# EAGLE design Fire_Alarm (EAGLE 9.6.2)
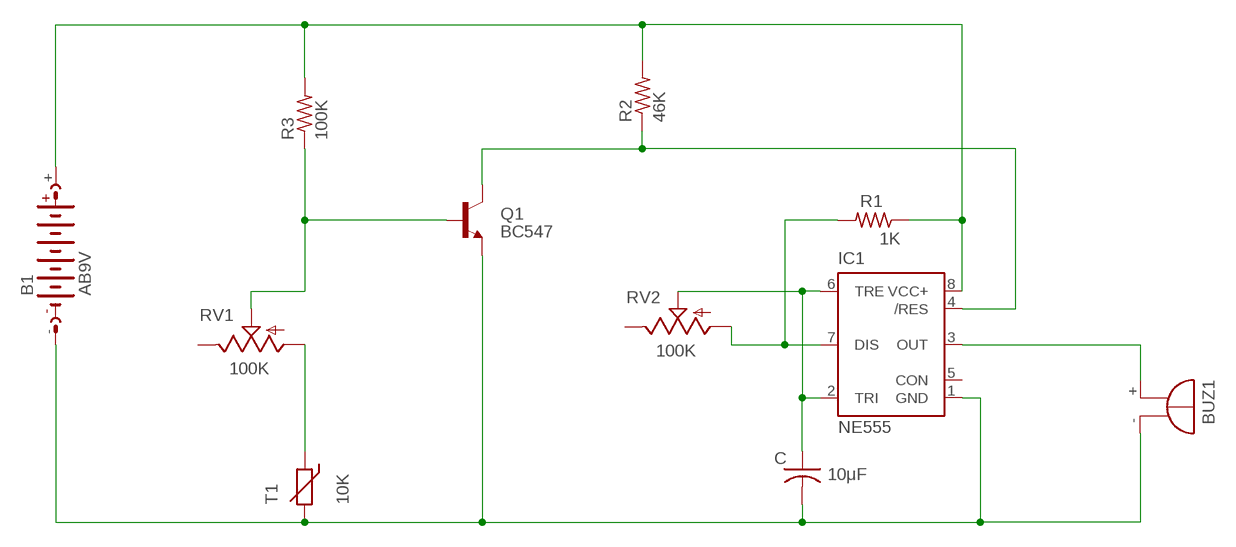
[diagram p0: schematic, sheet 1]

## Parts
B1  AB9V  [AB9V]
BUZ1  F/TMB  [F/TMB]
C  10μF  C-US050-024X044  [C050-024X044]
IC1  NE555  [DIL-08]
Q1  BC547  [TO92]
R1  1K  R-US_0204/7  [0204/7]
R2  46K  R-US_0204/7  [0204/7]
R3  100K  R-US_0204/7  [0204/7]
RV1  100K  TRIM_US-CA9V  [CA9V]
RV2  100K  TRIM_US-CA9V  [CA9V]
T1  10K  THERMISTOR-7,5  [R-7,5]

## Nets
N$1: BUZ1.+ IC1.3(OUT)
N$3: Q1.2(B) R3.1 RV1.S
N$4: RV1.A T1.1
N$5: B1.- BUZ1.- C.2 IC1.1(GND) Q1.1(E) T1.2
N$6: IC1.4(/RES) Q1.3(C) R2.1
N$7: IC1.7(DIS) R1.2 RV2.A
N$8: C.1 IC1.2(TRI) IC1.6(TRE) RV2.S
N$9: B1.+ IC1.8(VCC+) R1.1 R2.2 R3.2
Unconnected: IC1.5(CON) RV1.E RV2.E

## Library data of the parts
B1 = battery:AB9V: 9-V BATTERY CLIP
BUZ1 = buzzer:F/TMB: BUZZER Source: Buerklin; OC_FARNELL: unknown; OC_NEWARK: unknown
C = rcl:C-US: CAPACITOR, American symbol; SPICEPREFIX: C
IC1 = st-microelectronics:NE555: General purpose bipolar Timer; MF: Arrow Electronics; MPN: NE555N; OC_FARNELL: 1467742; OC_NEWARK: 89K1486
Q1 = transistor:BC547: NPN TRANSISTOR
R1-R3 = rcl:R-US_: RESISTOR, American symbol; SPICEPREFIX: R
RV1 RV2 = pot:TRIM_US-: POTENTIOMETER
T1 = varistor:THERMISTOR: THERMISTOR

## Board
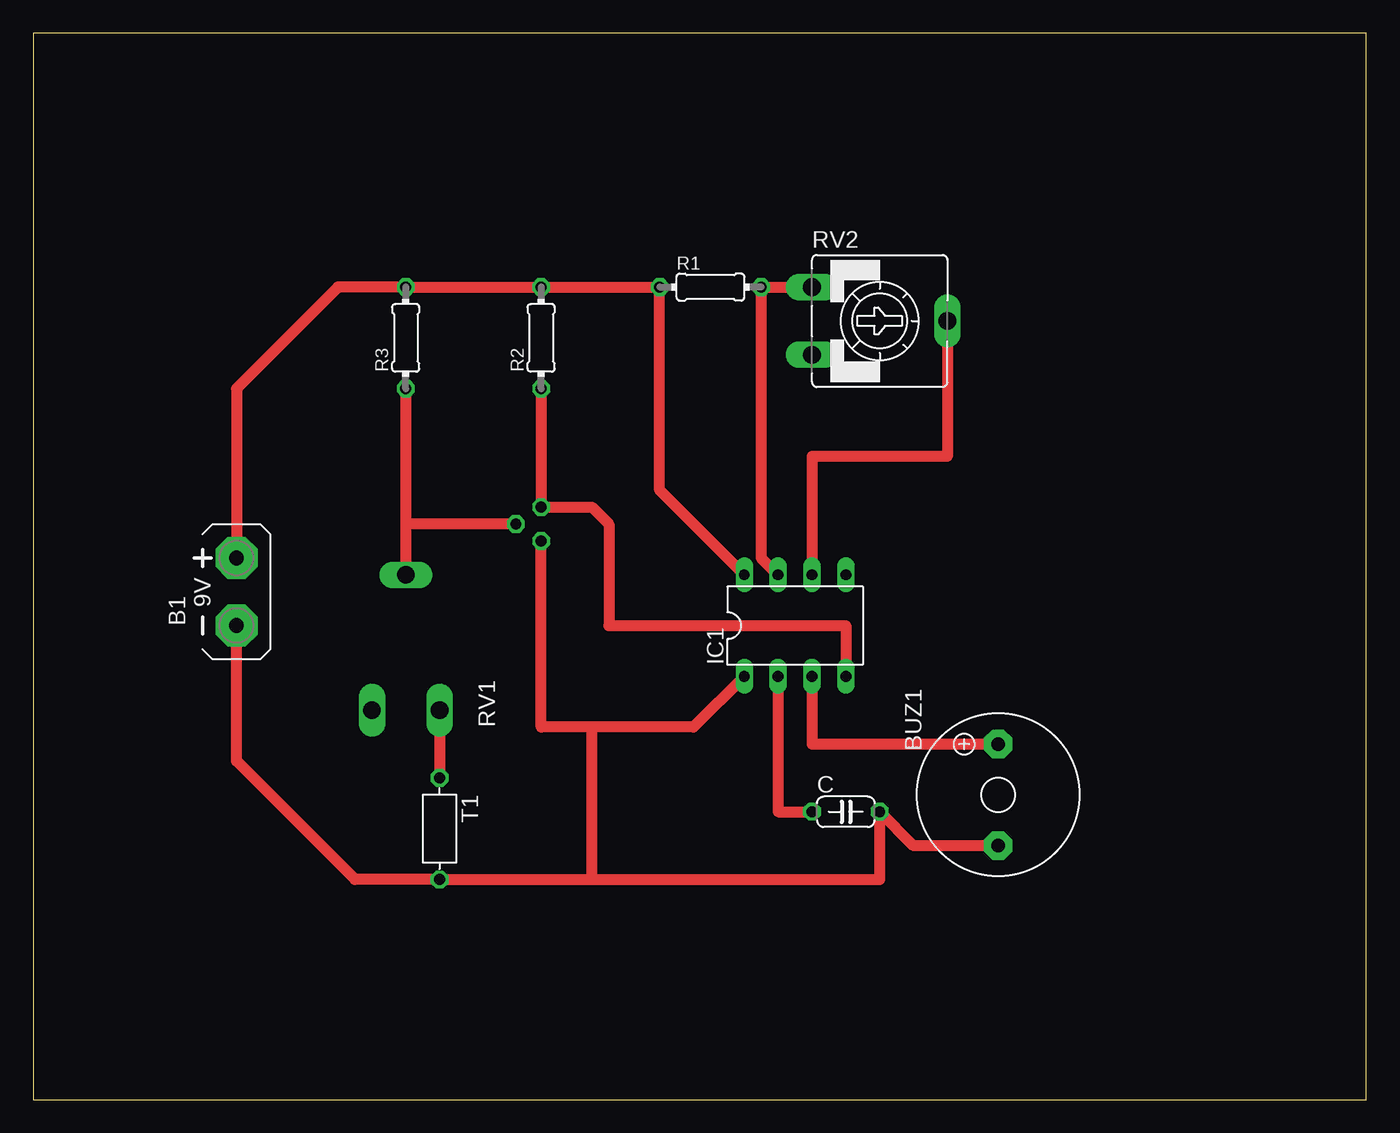
[diagram p1: board, top side]
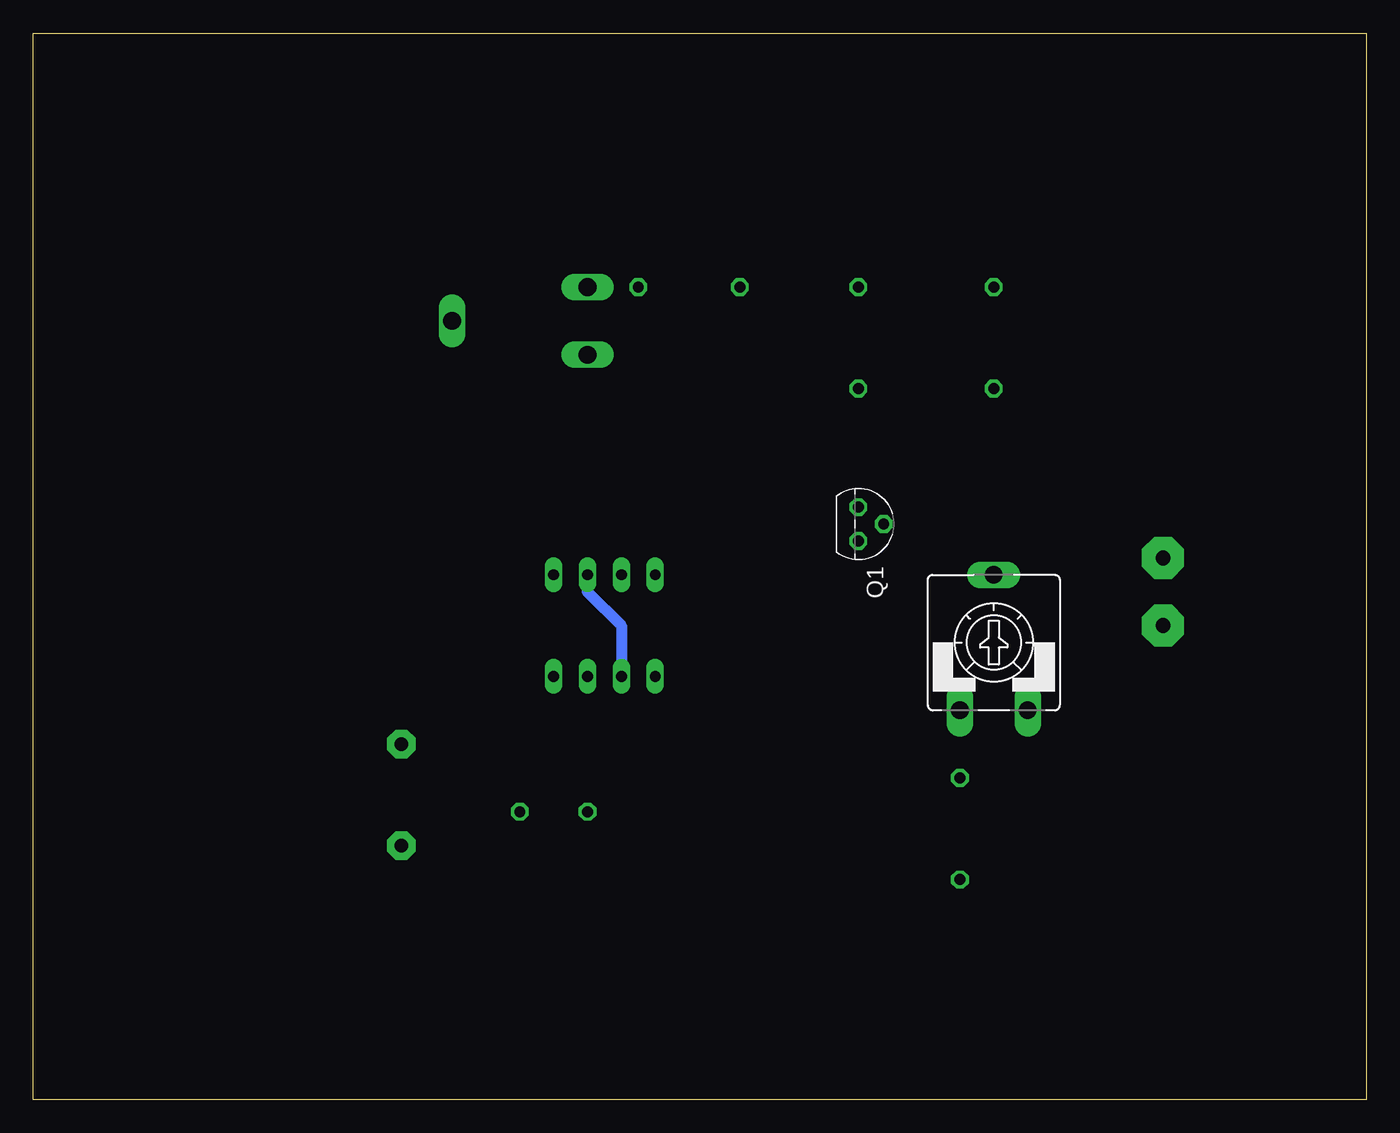
[diagram p2: board, bottom side, seen from below]

Size 100 x 80 mm. Coordinates in mm from the lower left corner, seen from the top.
Outline: 0,0 100,0 100,80 0,80 0,0
Copper layers (1*16): Top 0.035mm / dielectric 1.5mm / Bottom 0.035mm
Design rules "default": minimum track width 6mil, minimum drill 0.35mm, track to track 6mil, track to pad 6mil, pad to pad 6mil, via to via 6mil, smd to smd 6mil, copper to edge 40mil, drill to drill 6mil, minimum pad ring 10mil, minimum via ring 8mil, stop-mask expansion 4mil, vias tented up to drill 0mil, thermal gap 10mil

### Footprints (pad centres in the part's own frame; a part is rotated, then mirrored left to right if it is on the bottom)
AB9V = drill 1.118 pad 3.15 octagon: + 0,2.54; - 0,-2.54
F/TMB = drill 1.016 pad 2.159 octagon: + 3.81,0; - -3.81,0
C050-024X044 = drill 0.813 octagon: 1 -2.54,0; 2 2.54,0
DIL-08 = drill 0.813 long: 1 -3.81,-3.81; 2 -1.27,-3.81; 3 1.27,-3.81; 4 3.81,-3.81; 5 3.81,3.81; 6 1.27,3.81; 7 -1.27,3.81; 8 -3.81,3.81
TO92 = drill 0.813 octagon: 1 1.27,0; 2 0,1.905; 3 -1.27,0
0204/7 = drill 0.813 octagon: 1 -3.81,0; 2 3.81,0
CA9V = drill 1.321 long: A -2.54,-5.08; E 2.54,-5.08; S 0,5.08
R-7,5 = drill 0.813 octagon: 1 -3.81,0; 2 3.81,0

### Placement (x,y rotation side)
B1  15.24,38.1 0 top
BUZ1  72.39,22.86 90 top
C  60.96,21.59 0 top
IC1  57.15,35.56 0 top
Q1  38.1,43.18 270 bottom
R1  50.8,60.96 0 top
R2  38.1,57.15 90 top
R3  27.94,57.15 90 top
RV1  27.94,34.29 0 bottom
RV2  63.5,58.42 270 top
T1  30.48,20.32 270 top

### Tracks (layer width: path | path; a pad name or v marks a point on that pad's centre or on a via)
N$1
  Top 0.813: IC1.3 58.42,26.67 BUZ1.+
N$3
  Top 0.813: R3.1 27.94,43.18 | 27.94,43.18 RV1.S | Q1.2 27.94,43.18
N$4
  Top 0.813: RV1.A T1.1
N$5
  Top 0.813: Q1.1 38.1,27.94 41.91,27.94 | B1.- 15.24,25.4 24.13,16.51 T1.2 41.91,16.51 | 41.91,16.51 63.5,16.51 C.2 66.04,19.05 BUZ1.- | 41.91,16.51 41.91,27.94 | IC1.1 49.53,27.94 41.91,27.94
N$6
  Top 0.813: IC1.4 60.96,35.56 43.18,35.56 43.18,43.18 41.91,44.45 Q1.3 R2.1
N$7
  Top 0.813: IC1.7 54.61,40.64 R1.2 RV2.A
N$8
  Top 0.813: RV2.S 68.58,48.26 58.42,48.26 IC1.6 | IC1.2 55.88,21.59 C.1
  Bottom 0.152: 55.93,31.85 IC1.2 | 58.37,39.32 IC1.6
  Bottom 0.813: IC1.6 58.42,38.1 55.88,35.56 IC1.2
N$9
  Top 0.813: B1.+ 15.24,53.34 22.86,60.96 R3.2 R2.2 R1.1 46.99,45.72 IC1.8